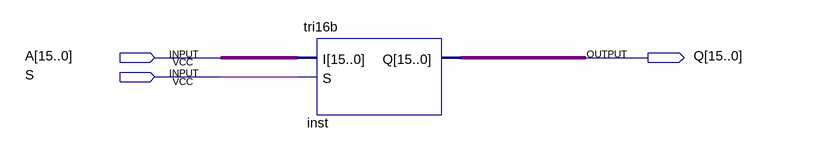
[diagram p0: schematic sheet]
// Quartus schematic CORDIC.bdf as structural Verilog: 1 symbols, 3 pins
module CORDIC (
  input  [15:0] A,
  input  S,
  output [15:0] Q
);

  tri16b inst (.I(A), .S(S), .Q(Q));
endmodule
